# Altium schematic sheet U_SDRAM.SchDoc
size A4; SheetNumber: 4; SheetTotal: 9
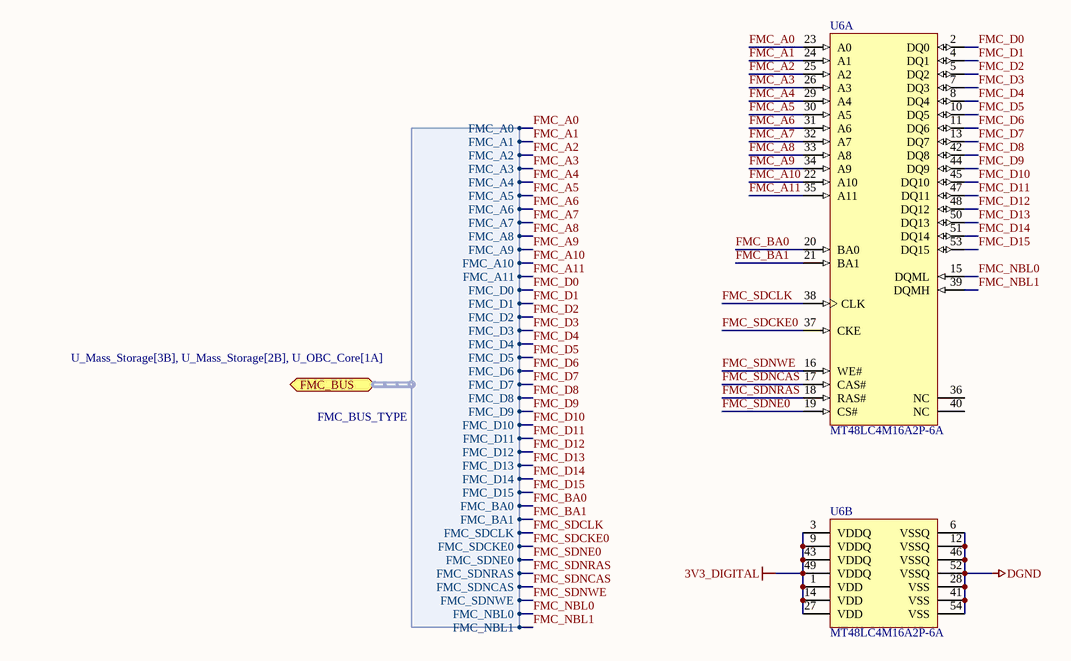
[diagram p0: U_SDRAM.SchDoc]

## Parts
U6  MT48LC4M16A2P-6A  [MICT-P-54_N]  (parts A,B of 2)

## Ports
FMC_BUS (bidir, harness FMC_BUS_TYPE, see U_Mass_Storage[3B], U_Mass_Storage[2B], U_OBC_Core[1A])

## Harnesses
FMC_BUS_TYPE: FMC_D2, FMC_D3, FMC_D4, FMC_D5, FMC_D6, FMC_D7, FMC_D8, FMC_D9, FMC_D10, FMC_D11, FMC_D12, FMC_D13, FMC_D14, FMC_D1, FMC_D15, FMC_D0, FMC_A0, FMC_A1, FMC_A2, FMC_A3, FMC_A4, FMC_A5, FMC_A6, FMC_A7, FMC_A8, FMC_A9, FMC_A10, FMC_A11, FMC_BA0, FMC_BA1, FMC_SDCLK, FMC_SDCKE0, FMC_SDNE0, FMC_SDNRAS, FMC_SDNCAS, FMC_SDNWE, FMC_NBL0, FMC_NBL1

## Nets
3V3_DIGITAL: U6.1(VDD) U6.3(VDDQ) U6.9(VDDQ) U6.14(VDD) U6.27(VDD) U6.43(VDDQ) U6.49(VDDQ)
DGND: U6.6(VSSQ) U6.12(VSSQ) U6.28(VSS) U6.41(VSS) U6.46(VSSQ) U6.52(VSSQ) U6.54(VSS)
FMC_A0: U6.23(A0) ; port FMC_BUS.FMC_A0
FMC_A1: U6.24(A1) ; port FMC_BUS.FMC_A1
FMC_A2: U6.25(A2) ; port FMC_BUS.FMC_A2
FMC_A3: U6.26(A3) ; port FMC_BUS.FMC_A3
FMC_A4: U6.29(A4) ; port FMC_BUS.FMC_A4
FMC_A5: U6.30(A5) ; port FMC_BUS.FMC_A5
FMC_A6: U6.31(A6) ; port FMC_BUS.FMC_A6
FMC_A7: U6.32(A7) ; port FMC_BUS.FMC_A7
FMC_A8: U6.33(A8) ; port FMC_BUS.FMC_A8
FMC_A9: U6.34(A9) ; port FMC_BUS.FMC_A9
FMC_A10: U6.22(A10) ; port FMC_BUS.FMC_A10
FMC_A11: U6.35(A11) ; port FMC_BUS.FMC_A11
FMC_BA0: U6.20(BA0) ; port FMC_BUS.FMC_BA0
FMC_BA1: U6.21(BA1) ; port FMC_BUS.FMC_BA1
FMC_D0: U6.2(DQ0) ; port FMC_BUS.FMC_D0
FMC_D1: U6.4(DQ1) ; port FMC_BUS.FMC_D1
FMC_D2: U6.5(DQ2) ; port FMC_BUS.FMC_D2
FMC_D3: U6.7(DQ3) ; port FMC_BUS.FMC_D3
FMC_D4: U6.8(DQ4) ; port FMC_BUS.FMC_D4
FMC_D5: U6.10(DQ5) ; port FMC_BUS.FMC_D5
FMC_D6: U6.11(DQ6) ; port FMC_BUS.FMC_D6
FMC_D7: U6.13(DQ7) ; port FMC_BUS.FMC_D7
FMC_D8: U6.42(DQ8) ; port FMC_BUS.FMC_D8
FMC_D9: U6.44(DQ9) ; port FMC_BUS.FMC_D9
FMC_D10: U6.45(DQ10) ; port FMC_BUS.FMC_D10
FMC_D11: U6.47(DQ11) ; port FMC_BUS.FMC_D11
FMC_D12: U6.48(DQ12) ; port FMC_BUS.FMC_D12
FMC_D13: U6.50(DQ13) ; port FMC_BUS.FMC_D13
FMC_D14: U6.51(DQ14) ; port FMC_BUS.FMC_D14
FMC_D15: U6.53(DQ15) ; port FMC_BUS.FMC_D15
FMC_NBL0: U6.15(DQML) ; port FMC_BUS.FMC_NBL0
FMC_NBL1: U6.39(DQMH) ; port FMC_BUS.FMC_NBL1
FMC_SDCKE0: U6.37(CKE) ; port FMC_BUS.FMC_SDCKE0
FMC_SDCLK: U6.38(CLK) ; port FMC_BUS.FMC_SDCLK
FMC_SDNCAS: U6.17(CAS#) ; port FMC_BUS.FMC_SDNCAS
FMC_SDNE0: U6.19(CS#) ; port FMC_BUS.FMC_SDNE0
FMC_SDNRAS: U6.18(RAS#) ; port FMC_BUS.FMC_SDNRAS
FMC_SDNWE: U6.16(WE#) ; port FMC_BUS.FMC_SDNWE

Not connected (* = marked no-connect by the designer): U6 36(NC) 40(NC)

## Library data of the parts
U6 = MT48LC4M16A2P: 64Mb PC133 SDR SDRAM, 4Mb x 16, 6ns, 3.3V, 0C to 70 degC, 54-Pin TSOP, Pb-Free; Manufacturer: Micron; Cycle Time: 6nsÂ; Voltage: 3.3VÂ; Op. Temp.: 0C to +70CÂ; CL: CL = 3Â; Density: 64MbÂ; Data Rate: PC133Â; Clock Rate: 166 MHzÂ; ComponentLink3URL: http://www.micron.com/~/media/Documents/Products/Data%20Sheet/DRAM/128mb_x4x8x16_sdram.pdf; Width: x16Â; Mounting Technology: Surface Mount; DatasheetVersion: Rev.Q; ComponentLink1Description: Manufacturer URL; ComponentLink2URL: http://www.micron.com/~/media/Documents/Products/Data%20Sheet/DRAM/128Mbx16x32Mobile.pdf; PackageDescription: 54-Pin Thin Small Outline Package, 10.16 x 22.22 mm, Pitch 0.8 mm; ComponentLink1URL: http://www.micron.com/; ComponentLink2Description: Datasheet; PackageVersion: Rev.Q; PartNumber: MT48LC4M16A2P-6A; RoHS: YesÂ; ComponentLink3Description: Package Specification; Depth: 4MbÂ; PackageReference: MICT-P-54